# Altium schematic sheet Header_Sheet_1.SchDoc
size A4; SheetNumber: 7; SheetTotal: 12
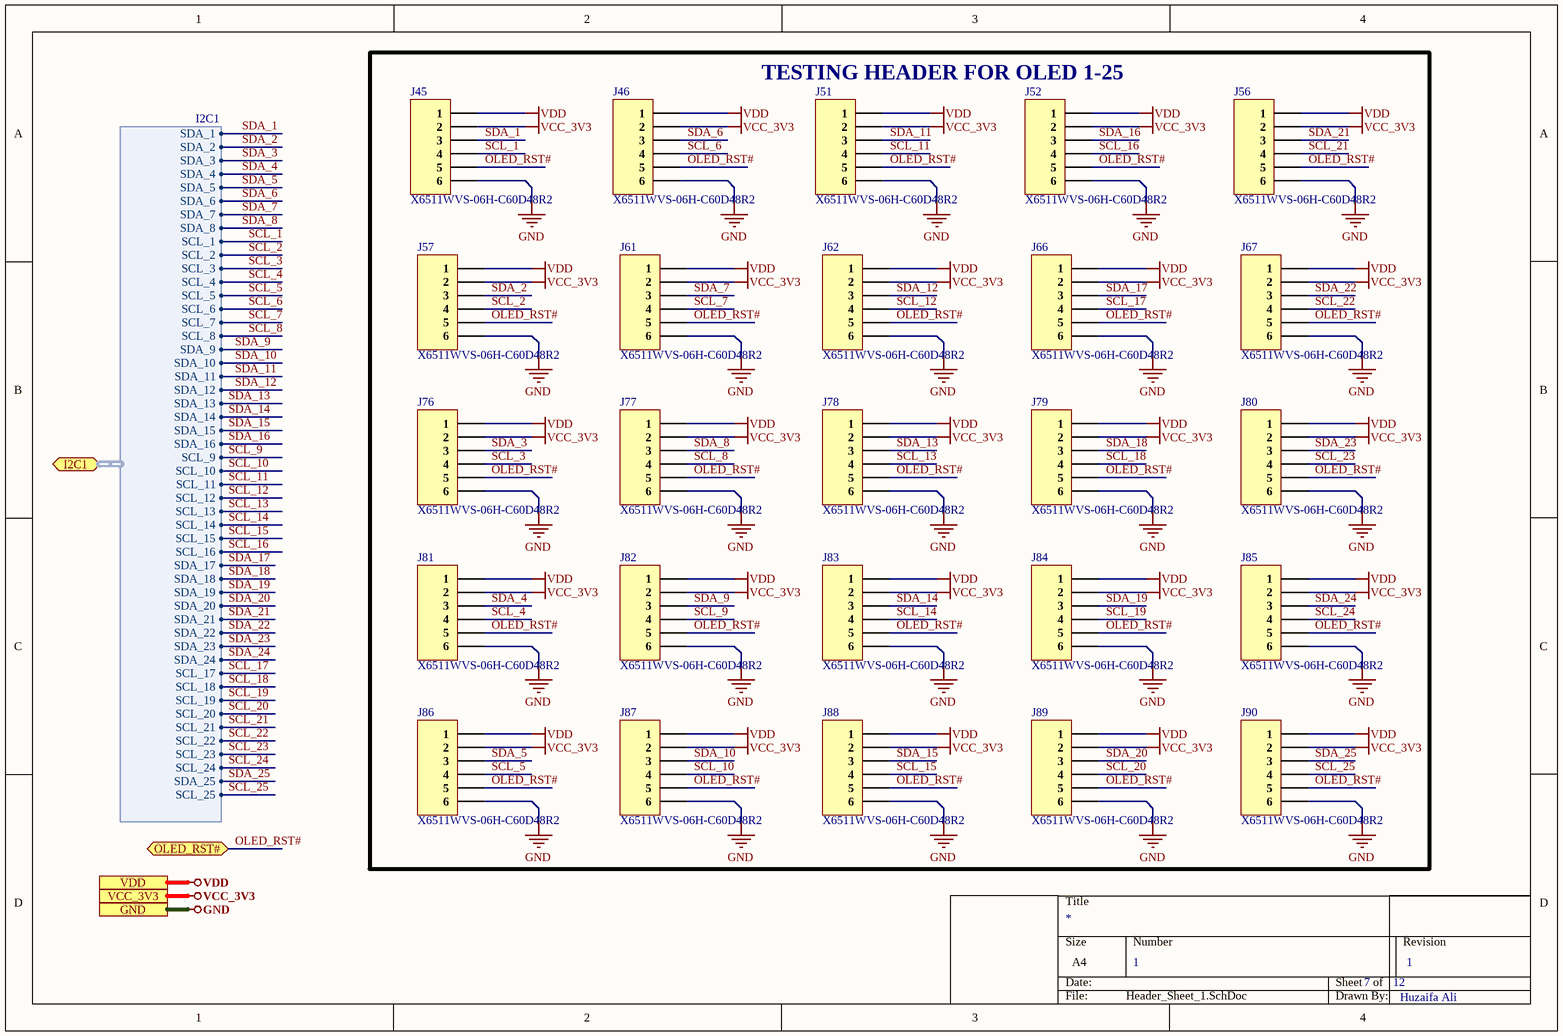
[diagram p0: Header_Sheet_1.SchDoc]

## Parts
J45  X6511WVS-06H-C60D48R2  [X6511WVS-06H-C60D48R2]
J46  X6511WVS-06H-C60D48R2  [X6511WVS-06H-C60D48R2]
J51  X6511WVS-06H-C60D48R2  [X6511WVS-06H-C60D48R2]
J52  X6511WVS-06H-C60D48R2  [X6511WVS-06H-C60D48R2]
J56  X6511WVS-06H-C60D48R2  [X6511WVS-06H-C60D48R2]
J57  X6511WVS-06H-C60D48R2  [X6511WVS-06H-C60D48R2]
J61  X6511WVS-06H-C60D48R2  [X6511WVS-06H-C60D48R2]
J62  X6511WVS-06H-C60D48R2  [X6511WVS-06H-C60D48R2]
J66  X6511WVS-06H-C60D48R2  [X6511WVS-06H-C60D48R2]
J67  X6511WVS-06H-C60D48R2  [X6511WVS-06H-C60D48R2]
J76  X6511WVS-06H-C60D48R2  [X6511WVS-06H-C60D48R2]
J77  X6511WVS-06H-C60D48R2  [X6511WVS-06H-C60D48R2]
J78  X6511WVS-06H-C60D48R2  [X6511WVS-06H-C60D48R2]
J79  X6511WVS-06H-C60D48R2  [X6511WVS-06H-C60D48R2]
J80  X6511WVS-06H-C60D48R2  [X6511WVS-06H-C60D48R2]
J81  X6511WVS-06H-C60D48R2  [X6511WVS-06H-C60D48R2]
J82  X6511WVS-06H-C60D48R2  [X6511WVS-06H-C60D48R2]
J83  X6511WVS-06H-C60D48R2  [X6511WVS-06H-C60D48R2]
J84  X6511WVS-06H-C60D48R2  [X6511WVS-06H-C60D48R2]
J85  X6511WVS-06H-C60D48R2  [X6511WVS-06H-C60D48R2]
J86  X6511WVS-06H-C60D48R2  [X6511WVS-06H-C60D48R2]
J87  X6511WVS-06H-C60D48R2  [X6511WVS-06H-C60D48R2]
J88  X6511WVS-06H-C60D48R2  [X6511WVS-06H-C60D48R2]
J89  X6511WVS-06H-C60D48R2  [X6511WVS-06H-C60D48R2]
J90  X6511WVS-06H-C60D48R2  [X6511WVS-06H-C60D48R2]

## Blocks framed on the sheet
TESTING HEADER FOR OLED 1-25: J45 J46 J51 J52 J56 J57 J61 J62 J66 J67 J76-J90

## Ports
GND, I2C1 (bidir, harness I2C1), OLED_RST# (bidir), VCC_3V3, VDD

## Harnesses
I2C1: SDA_1, SDA_2, SDA_3, SDA_4, SDA_5, SDA_6, SDA_7, SDA_8, SCL_1, SCL_2, SCL_3, SCL_4, SCL_5, SCL_6, SCL_7, SCL_8, SDA_9, SDA_10, SDA_11, SDA_12, SDA_13, SDA_14, SDA_15, SDA_16, SCL_9, SCL_10, SCL_11, SCL_12, SCL_13, SCL_14, SCL_15, SCL_16, SDA_17, SDA_18, SDA_19, SDA_20, SDA_21, SDA_22, SDA_23, SDA_24, SCL_17, SCL_18, SCL_19, SCL_20, SCL_21, SCL_22, SCL_23, SCL_24, SDA_25, SCL_25

## Nets
GND: J45.6 J46.6 J51.6 J52.6 J56.6 J57.6 J61.6 J62.6 J66.6 J67.6 J76.6 J77.6 J78.6 J79.6 J80.6 J81.6 J82.6 J83.6 J84.6 J85.6 J86.6 J87.6 J88.6 J89.6 J90.6 ; port GND
VCC_3V3: J45.2 J46.2 J51.2 J52.2 J56.2 J57.2 J61.2 J62.2 J66.2 J67.2 J76.2 J77.2 J78.2 J79.2 J80.2 J81.2 J82.2 J83.2 J84.2 J85.2 J86.2 J87.2 J88.2 J89.2 J90.2 ; port VCC_3V3
VDD: J45.1 J46.1 J51.1 J52.1 J56.1 J57.1 J61.1 J62.1 J66.1 J67.1 J76.1 J77.1 J78.1 J79.1 J80.1 J81.1 J82.1 J83.1 J84.1 J85.1 J86.1 J87.1 J88.1 J89.1 J90.1 ; port VDD
OLED_RST#: J45.5 J46.5 J51.5 J52.5 J56.5 J57.5 J61.5 J62.5 J66.5 J67.5 J76.5 J77.5 J78.5 J79.5 J80.5 J81.5 J82.5 J83.5 J84.5 J85.5 J86.5 J87.5 J88.5 J89.5 J90.5 ; port OLED_RST#
SCL_1: J45.4 ; port I2C1.SCL_1
SCL_2: J57.4 ; port I2C1.SCL_2
SCL_3: J76.4 ; port I2C1.SCL_3
SCL_4: J81.4 ; port I2C1.SCL_4
SCL_5: J86.4 ; port I2C1.SCL_5
SCL_6: J46.4 ; port I2C1.SCL_6
SCL_7: J61.4 ; port I2C1.SCL_7
SCL_8: J77.4 ; port I2C1.SCL_8
SCL_9: J82.4 ; port I2C1.SCL_9
SCL_10: J87.4 ; port I2C1.SCL_10
SCL_11: J51.4 ; port I2C1.SCL_11
SCL_12: J62.4 ; port I2C1.SCL_12
SCL_13: J78.4 ; port I2C1.SCL_13
SCL_14: J83.4 ; port I2C1.SCL_14
SCL_15: J88.4 ; port I2C1.SCL_15
SCL_16: J52.4 ; port I2C1.SCL_16
SCL_17: J66.4 ; port I2C1.SCL_17
SCL_18: J79.4 ; port I2C1.SCL_18
SCL_19: J84.4 ; port I2C1.SCL_19
SCL_20: J89.4 ; port I2C1.SCL_20
SCL_21: J56.4 ; port I2C1.SCL_21
SCL_22: J67.4 ; port I2C1.SCL_22
SCL_23: J80.4 ; port I2C1.SCL_23
SCL_24: J85.4 ; port I2C1.SCL_24
SCL_25: J90.4 ; port I2C1.SCL_25
SDA_1: J45.3 ; port I2C1.SDA_1
SDA_2: J57.3 ; port I2C1.SDA_2
SDA_3: J76.3 ; port I2C1.SDA_3
SDA_4: J81.3 ; port I2C1.SDA_4
SDA_5: J86.3 ; port I2C1.SDA_5
SDA_6: J46.3 ; port I2C1.SDA_6
SDA_7: J61.3 ; port I2C1.SDA_7
SDA_8: J77.3 ; port I2C1.SDA_8
SDA_9: J82.3 ; port I2C1.SDA_9
SDA_10: J87.3 ; port I2C1.SDA_10
SDA_11: J51.3 ; port I2C1.SDA_11
SDA_12: J62.3 ; port I2C1.SDA_12
SDA_13: J78.3 ; port I2C1.SDA_13
SDA_14: J83.3 ; port I2C1.SDA_14
SDA_15: J88.3 ; port I2C1.SDA_15
SDA_16: J52.3 ; port I2C1.SDA_16
SDA_17: J66.3 ; port I2C1.SDA_17
SDA_18: J79.3 ; port I2C1.SDA_18
SDA_19: J84.3 ; port I2C1.SDA_19
SDA_20: J89.3 ; port I2C1.SDA_20
SDA_21: J56.3 ; port I2C1.SDA_21
SDA_22: J67.3 ; port I2C1.SDA_22
SDA_23: J80.3 ; port I2C1.SDA_23
SDA_24: J85.3 ; port I2C1.SDA_24
SDA_25: J90.3 ; port I2C1.SDA_25

## Notes on the sheet
- 1
- Huzaifa Ali

## Library data of the parts
J45 J46 J51 J52 J56 J57 J61 J62 J66 J67 J76-J90 = X6511WVS-06H-C60D48R2: 6 POS 2.54mm SMD Header; Manufacturer: XKB Connectivity; Voltage Rating (Max): 250V; Current Rating (Max): 3A; Circluar Pins/Square Pins: Square Pins; ComponentLink1Description: LCSC; ComponentLink1URL: https://lcsc.com/product-detail/span-style-background-color-ff0-Pin-span-Headers_XKB-Connectivity-X6511WVS-06H-C60D48R2_C2883763.html; Insulation Height: 2.5mm; Length of Mating Pin: 6mm